# EasyEDA Pro project IMPORT-THIS-IN-KICAD.epro, board PCB1
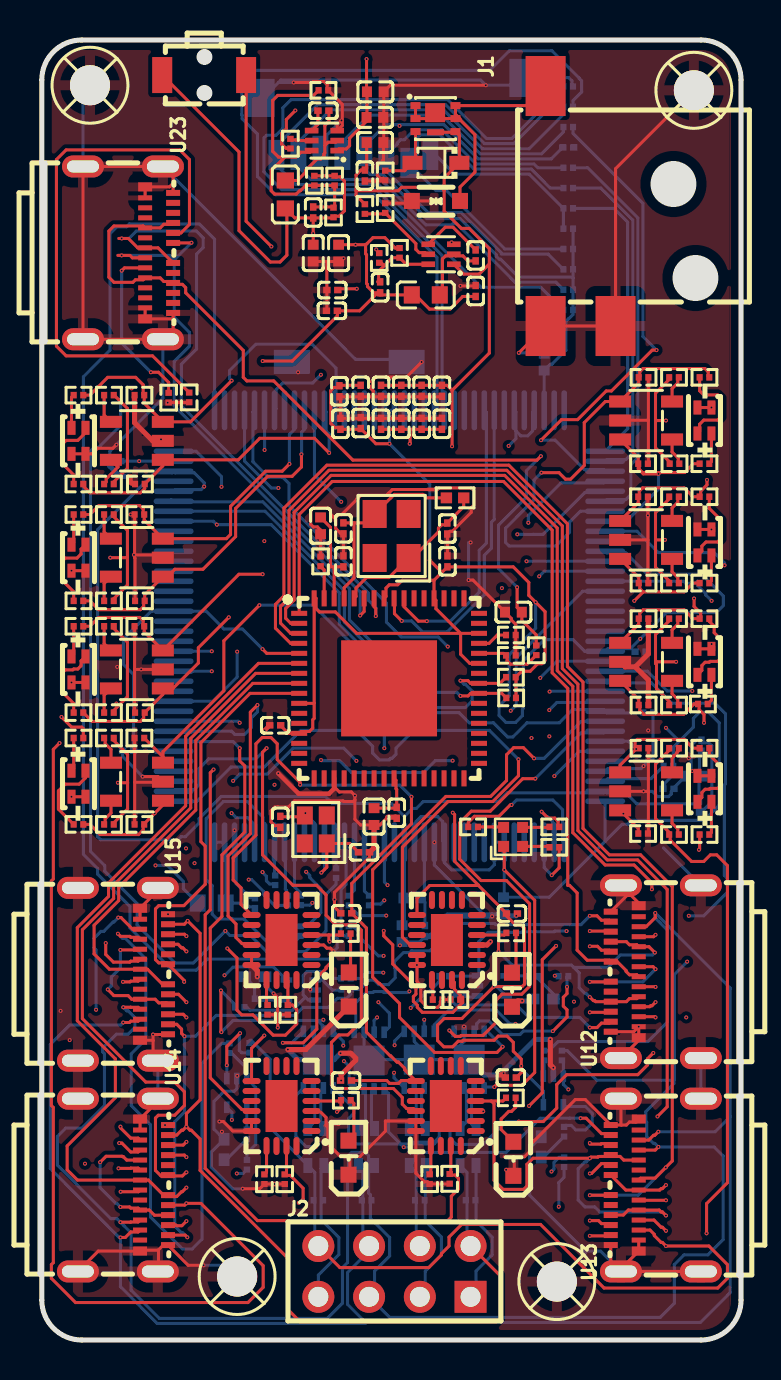
[diagram p1: board, top side]
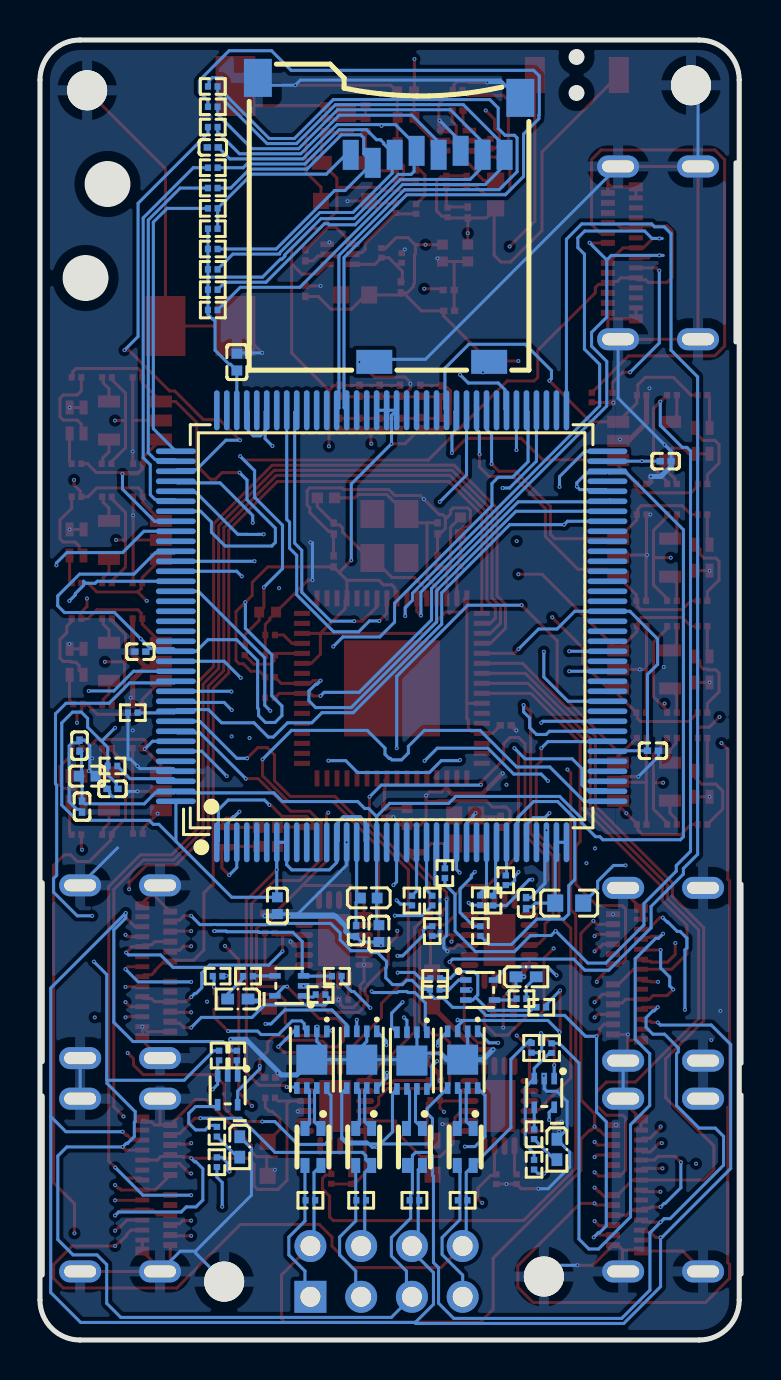
[diagram p2: board, bottom side, seen from below]

Outline 35.09 x 65 mm; copper layers: Top Layer, Inner1, Inner2, Bottom Layer. Coordinates in mm from the lower left corner of the outline.
Outline path: 0.09,63 0.09,2 arc(0.68,0.59) 2.09,0 33.09,0 arc(34.51,0.59) 35.09,2 35.09,63 arc(34.51,64.41) 33.09,65 2.09,65 arc(0.68,64.41) 0.09,63
Stack: Top Layer 0.035mm Outer layer thickness 1oz / dielectric 0.2104mm 7628 RC49% 8.6mil / dielectric 1.065mm 1.1mm H/HOZ Copper / dielectric 0.2104mm 7628 RC49% 8.6mil / Inner1 0.0152mm Inner layer thickness / Inner2 0.0152mm Inner layer thickness / Bottom Layer 0.035mm Outer layer thickness 1oz

## Placement (name value [footprint] x y rotation side)
C1  10uF  [C0402]  16.77 61.13 180 top
C2  10uF  [C0402]  16.79 62.41 180 top
C3  100nF  [C0201]  21.81 52.45 90 top
C4  100nF  [C0201]  17.03 52.64 270 top
C5  100nF  [C0201]  21.81 54.23 270 top
C6  100nF  [C0201]  16.26 58.22 270 top
C7  10uF  [C0402]  16.77 59.87 180 top
C8  10uF  [C0402]  13.68 54.34 90 top
C9  100nF  [C0201]  14.63 52.5 180 top
C10  100nF  [C0201]  13.68 56.38 270 top
C11  100nF  [C0201]  14.19 61.47 0 top
C12  100nF  [C0201]  14.61 51.46 180 top
C13  10uF  [C0402]  14.95 54.34 90 top
C14  100nF  [C0201]  20.12 45.81 270 top
C15  100nF  [C0201]  14.99 47.44 90 top
C16  100nF  [C0201]  17.07 47.46 90 top
C17  100nF  [C0201]  19.1 45.81 270 top
C18  100nF  [C0201]  16.05 45.85 270 top
C19  100nF  [C0201]  18.09 47.46 90 top
C20  100nF  [C0201]  18.09 45.81 270 top
C21  100nF  [C0201]  15.04 45.81 270 top
C22  100nF  [C0201]  19.1 47.46 90 top
C23  100nF  [C0201]  17.07 45.81 270 top
C24  100nF  [C0201]  16.05 47.46 90 top
C25  100nF  [C0201]  20.12 47.46 90 top
C26  10uF  [C0201]  23.62 21.32 180 top
C27  10uF  [C0201]  23.57 13.12 0 top
C28  10uF  [C0201]  15.32 12.97 0 top
C29  10uF  [C0201]  15.33 21.34 0 top
C30  10uF  [C0402]  25.24 48.89 270 bottom
C31  10uF  [C0402]  23.21 21.72 90 bottom
C32  100nF  [C0201]  31.46 27.56 180 bottom
C33  100nF  [C0201]  3.77 43.94 0 bottom
C34  100nF  [C0201]  4.41 29.46 0 bottom
C35  100nF  [C0201]  30.06 34.42 180 bottom
C36  100nF  [C0201]  10.76 21.84 270 bottom
C37  10uF  [C0402]  32.73 28.19 0 bottom
C38  220pF  [C0201]  19.27 20.45 270 bottom
C39  10uF  [C0402]  18.12 20.32 90 bottom
C40  100nF  [C0201]  32.98 26.67 90 bottom
C41  100nF  [C0201]  33.11 29.72 270 bottom
C42  12pF  [C0201]  16.22 24.38 0 top
C43  12pF  [C0201]  12.03 25.91 90 top
C44  10uF  [C0201]  26.44 59.63 180 bottom
C45  12pF  [C0201]  15.19 40.58 270 top
C46  100nF  [C0201]  20.4 38.93 270 top
C47  100nF  [C0201]  11.78 30.73 0 top
C48  10uF  [C0402]  23.7 36.39 0 top
C49  10uF  [C0402]  16.72 26.17 90 top
C50  100nF  [C0201]  17.86 26.36 90 top
C51  100nF  [C0201]  15.19 38.93 270 top
C52  10uF  [C0402]  14.05 40.71 90 top
C53  12pF  [C0201]  20.39 40.57 270 top
D1  B140WS-7  [SOD-323_L1.8-W1.3-LS2.5-RD]  19.82 58.86 180 top
D2  SOD-323  [SOD-323_L1.7-W1.3-LS2.5-BI]  19.82 56.95 180 top
J1  DC-044D-2.5A-2.0-SMT  [DC-IN-SMD_DC-044D-2.5A-2.0-SMT]  27.06 56.7 270 top
J2  SSQ-104-04-T-D  [HDR-TH_8P-P2.54_SSW-104-23-F-D]  17.74 3.43 0 top
L1  3.3uH  [L0603]  19.31 52.25 180 top
L2  3.3uH  [L0603]  12.28 57.28 270 top
L3  ACM2012-900-2P-T001  [FILTER-SMD_4P-L2.0-W1.2-TL_ACM2012E]  21.43 9.65 270 bottom
L4  ACM2012-900-2P-T001  [FILTER-SMD_4P-L2.0-W1.2-TL_ACM2012E]  18.89 9.65 270 bottom
L5  ACM2012-900-2P-T001  [FILTER-SMD_4P-L2.0-W1.2-TL_ACM2012E]  16.35 9.65 270 bottom
L6  ACM2012-900-2P-T001  [FILTER-SMD_4P-L2.0-W1.2-TL_ACM2012E]  13.81 9.65 270 bottom
L7  2.2uH  [L0402]  18.63 22.1 0 bottom
L8  3.3uH  [L0603]  8.6 21.84 0 bottom
LED1  APHHS1005LSECK/J3-PF  [LED0402-RD_RED]  25.19 17.05 0 bottom
LED2  APHHS1005LSECK/J3-PF  [LED0402-RD_RED]  10.76 18.16 180 bottom
LED3  APHHS1005LSECK/J3-PF  [LED0402-RD_RED]  25.09 9.65 270 bottom
LED4  APHHS1005LSECK/J3-PF  [LED0402-RD_RED]  9.22 9.53 270 bottom
LED5  HSMF-C163  [LED-SMD_L1.6-W0.8_HSMF-C163]  1.93 27.81 270 top
LED6  HSMF-C163  [LED-SMD_L1.6-W0.8_HSMF-C163]  1.93 33.53 270 top
LED7  HSMF-C163  [LED-SMD_L1.6-W0.8_HSMF-C163]  1.93 39.12 270 top
LED8  HSMF-C163  [LED-SMD_L1.6-W0.8_HSMF-C163]  1.93 44.96 270 top
LED9  HSMF-C163  [LED-SMD_L1.6-W0.8_HSMF-C163]  33.26 45.97 90 top
LED10  HSMF-C163  [LED-SMD_L1.6-W0.8_HSMF-C163]  33.26 39.88 90 top
LED11  HSMF-C163  [LED-SMD_L1.6-W0.8_HSMF-C163]  33.26 33.91 90 top
LED12  HSMF-C163  [LED-SMD_L1.6-W0.8_HSMF-C163]  33.26 27.56 90 top
LED13  SLED-0603-H0_8MM_C9900013124  [LED0603-R-RD_RED]  23.62 17.51 90 top
LED14  SLED-0603-H0_8MM_C9900013124  [LED0603-R-RD_RED]  23.7 9.06 90 top
LED15  SLED-0603-H0_8MM_C9900013124  [LED0603-R-RD_RED]  15.44 9.12 90 top
LED16  SLED-0603-H0_8MM_C9900013124  [LED0603-R-RD_RED]  15.46 17.53 90 top
LED17  TZ1615RGB3U-Common Yang  [LED-SMD_TZ1615RGB3U-COMMON-YANG]  23.68 25.16 0 top
Q1  AON2403  [DFN-6_L2.0-W2.0-P0.65-BL-EP-1]  19.8 61.05 270 top
Q2  QS5K2TR  [SOT-23-5_L2.9-W1.6-P0.95-LS2.8-TL]  4.86 27.92 180 top
Q3  QS5K2TR  [SOT-23-5_L2.9-W1.6-P0.95-LS2.8-TL]  4.85 33.53 180 top
Q4  QS5K2TR  [SOT-23-5_L2.9-W1.6-P0.95-LS2.8-TL]  4.85 39.12 180 top
Q5  QS5K2TR  [SOT-23-5_L2.9-W1.6-P0.95-LS2.8-TL]  4.85 44.96 180 top
Q6  QS5K2TR  [SOT-23-5_L2.9-W1.6-P0.95-LS2.8-TL]  30.34 45.97 0 top
Q7  QS5K2TR  [SOT-23-5_L2.9-W1.6-P0.95-LS2.8-TL]  30.34 40 0 top
Q8  QS5K2TR  [SOT-23-5_L2.9-W1.6-P0.95-LS2.8-TL]  30.34 33.91 0 top
Q9  QS5K2TR  [SOT-23-5_L2.9-W1.6-P0.95-LS2.8-TL]  30.34 27.43 0 top
R1  52.3kΩ  [R0201]  18 54.36 90 top
R2  10kΩ  [R0201]  16.98 54.1 90 top
R3  10kΩ  [R0201]  17.28 56.6 90 top
R4  10kΩ  [R0201]  16.26 56.55 270 top
R5  1kΩ  [R0201]  17.28 58.22 270 top
R6  100kΩ  [R0201]  14.75 57.97 90 top
R7  100kΩ  [R0201]  13.73 57.97 90 top
R8  100kΩ  [R0201]  14.69 56.38 270 top
R9  10kΩ  [R0201]  14.19 62.48 180 top
R10  10kΩ  [R0201]  12.54 59.82 270 top
R11  62Ω  [R0201]  21.55 6.99 180 bottom
R12  62Ω  [R0201]  19.01 6.99 180 bottom
R13  62Ω  [R0201]  16.35 6.99 180 bottom
R14  62Ω  [R0201]  13.93 6.99 180 bottom
R15  10kΩ  [R0201]  21.05 17.27 0 bottom
R16  10kΩ  [R0201]  20.23 18.19 0 bottom
R17  100kΩ  [R0201]  26.2 18.19 0 bottom
R18  2.7kΩ  [R0201]  24.68 18.19 0 bottom
R19  10kΩ  [R0201]  15.33 17.53 180 bottom
R20  10kΩ  [R0201]  15.31 18.08 180 bottom
R21  100kΩ  [R0201]  10 16.64 180 bottom
R22  2.7kΩ  [R0201]  10.99 17.07 180 bottom
R23  10kΩ  [R0201]  25.24 14.22 270 bottom
R24  10kΩ  [R0201]  26.13 14.22 270 bottom
R25  100kΩ  [R0201]  26.23 8.89 270 bottom
R26  2.7kΩ  [R0201]  26.23 10.41 270 bottom
R27  10kΩ  [R0201]  10.49 14.61 270 bottom
R28  10kΩ  [R0201]  9.48 14.59 270 bottom
R29  100kΩ  [R0201]  10.36 8.76 270 bottom
R30  2.7kΩ  [R0201]  10.36 10.29 270 bottom
R31  10kΩ  [R0201]  4.98 25.78 0 top
R32  10kΩ  [R0201]  4.98 30.1 0 top
R33  1kΩ  [R0201]  3.45 25.78 0 top
R34  100Ω  [R0201]  3.45 30.1 0 top
R35  100Ω  [R0201]  1.93 30.1 0 top
R36  100Ω  [R0201]  1.93 25.78 0 top
R37  10kΩ  [R0201]  5 31.37 0 top
R38  100Ω  [R0201]  1.93 35.69 0 top
R39  100Ω  [R0201]  1.93 31.37 0 top
R40  1kΩ  [R0201]  3.45 31.37 0 top
R41  100Ω  [R0201]  3.45 35.69 0 top
R42  10kΩ  [R0201]  4.98 35.69 0 top
R43  100Ω  [R0201]  1.93 41.28 0 top
R44  100Ω  [R0201]  1.93 36.96 0 top
R45  1kΩ  [R0201]  3.45 36.96 0 top
R46  100Ω  [R0201]  3.45 41.28 0 top
R47  10kΩ  [R0201]  5 36.96 0 top
R48  10kΩ  [R0201]  4.98 41.28 0 top
R49  100Ω  [R0201]  1.93 47.24 0 top
R50  100Ω  [R0201]  1.93 42.8 0 top
R51  1kΩ  [R0201]  3.45 42.8 0 top
R52  100Ω  [R0201]  3.45 47.24 0 top
R53  10kΩ  [R0201]  5 42.8 0 top
R54  10kΩ  [R0201]  4.98 47.24 0 top
R55  100Ω  [R0201]  33.26 43.81 180 top
R56  100Ω  [R0201]  33.26 48.13 0 top
R57  1kΩ  [R0201]  31.74 48.13 180 top
R58  100Ω  [R0201]  31.76 43.81 180 top
R59  10kΩ  [R0201]  30.21 48.13 180 top
R60  10kΩ  [R0201]  30.19 43.81 180 top
R61  100Ω  [R0201]  33.26 37.85 180 top
R62  100Ω  [R0201]  33.26 42.16 180 top
R63  1kΩ  [R0201]  31.74 42.16 180 top
R64  100Ω  [R0201]  31.74 37.85 180 top
R65  10kΩ  [R0201]  30.19 42.16 180 top
R66  10kΩ  [R0201]  30.21 37.85 180 top
R67  100Ω  [R0201]  33.18 31.8 180 top
R68  100Ω  [R0201]  33.26 36.07 180 top
R69  1kΩ  [R0201]  31.74 36.07 180 top
R70  100Ω  [R0201]  31.74 31.75 180 top
R71  10kΩ  [R0201]  30.21 36.07 180 top
R72  10kΩ  [R0201]  30.21 31.75 180 top
R73  100Ω  [R0201]  33.26 25.27 180 top
R74  100Ω  [R0201]  33.26 29.59 180 top
R75  1kΩ  [R0201]  31.74 29.59 180 top
R76  100Ω  [R0201]  31.74 25.27 180 top
R77  10kΩ  [R0201]  30.21 29.59 180 top
R78  10kΩ  [R0201]  30.19 25.32 180 top
R79  28kΩ  [R0201]  19.9 17.02 0 top
R80  33kΩ  [R0201]  20.79 17.02 180 top
R81  3.3kΩ  [R0201]  23.59 20.36 180 top
R82  33kΩ  [R0201]  20.51 8.06 270 top
R83  28kΩ  [R0201]  19.5 8.04 270 top
R84  3.3kΩ  [R0201]  23.57 12.11 180 top
R85  33kΩ  [R0201]  12.25 8.04 270 top
R86  28kΩ  [R0201]  11.24 8.04 270 top
R87  3.3kΩ  [R0201]  15.31 11.99 180 top
R88  33kΩ  [R0201]  12.41 16.51 270 top
R89  28kΩ  [R0201]  11.39 16.51 270 top
R90  3.3kΩ  [R0201]  15.31 20.32 180 top
R91  1kΩ  [R0201]  25.75 24.64 180 top
R92  1kΩ  [R0201]  25.75 25.65 0 top
R93  1kΩ  [R0201]  21.68 25.65 180 top
R94  100kΩ  [R0201]  13.06 21.98 270 bottom
R95  100kΩ  [R0201]  12.41 21.97 270 bottom
R96  100kΩ  [R0201]  11.78 22.99 270 bottom
R97  100kΩ  [R0201]  13.05 20.45 90 bottom
R98  100kΩ  [R0201]  16.47 21.97 270 bottom
R99  100kΩ  [R0201]  15.46 21.97 270 bottom
R100  100kΩ  [R0201]  15.46 20.45 90 bottom
R101  100kΩ  [R0201]  14.82 23.34 270 bottom
R102  10kΩ  [R0201]  31.46 28.7 0 bottom
R103  10kΩ  [R0201]  30.44 31.37 180 bottom
R104  10kΩ  [R0201]  26.44 52.52 0 bottom
R105  10kΩ  [R0201]  26.44 51.5 0 bottom
R106  10kΩ  [R0201]  26.44 55.57 0 bottom
R107  10kΩ  [R0201]  26.44 54.55 0 bottom
R108  10kΩ  [R0201]  26.44 53.53 0 bottom
R109  0Ω  [R0201]  26.44 61.66 0 bottom
R110  0Ω  [R0201]  26.44 62.68 0 bottom
R111  0Ω  [R0201]  26.44 56.58 0 bottom
R112  0Ω  [R0201]  26.44 57.6 0 bottom
R113  0Ω  [R0201]  26.44 58.61 0 bottom
R114  0Ω  [R0201]  26.44 60.65 0 bottom
R115  10kΩ  [R0201]  7.47 47.13 270 top
R116  10kΩ  [R0201]  6.44 47.12 90 top
R117  12kΩ  [R0201]  14.05 38.93 90 top
R118  1MΩ  [R0402]  20.78 42.11 180 top
R119  10kΩ  [R0201]  23.57 35.25 180 top
R120  10kΩ  [R0201]  23.57 33.14 180 top
R121  10kΩ  [R0201]  23.58 32.1 180 top
R122  100kΩ  [R0201]  24.84 34.49 270 top
R123  100kΩ  [R0201]  23.57 34.23 0 top
SCREW1  -  [Screw-Hole-M2]  32.73 62.48 0 top
SCREW2  -  [Screw-Hole-M2]  2.5 62.74 0 top
SCREW3  -  [Screw-Hole-M2]  25.87 2.92 0 top
SCREW4  -  [Screw-Hole-M2]  9.87 3.18 0 top
SW1  TS-1809-T20  [SW-SMD_L3.9-W2.9-LS4.8SWQC_SPST]  8.22 63.25 90 top
U1  AP62300Z6-7  [SOT-563-6_L1.6-W1.2-P0.50-LS1.6-BL]  20.07 54.29 90 top
U2  AP62300Z6-7  [SOT-563-6_L1.6-W1.2-P0.50-LS1.6-BL]  14.24 59.97 90 top
U3  MCP2542FDT-E/MNY  [TDFN-8_L3.0-W2.0-P0.50-TL-EP]  21.48 14.02 270 bottom
U4  MCP2542FDT-E/MNY  [TDFN-8_L3.0-W2.0-P0.50-TL-EP]  18.98 14.02 270 bottom
U5  MCP2542FDT-E/MNY  [TDFN-8_L3.0-W2.0-P0.50-TL-EP]  16.47 13.97 270 bottom
U6  MCP2542FDT-E/MNY  [TDFN-8_L3.0-W2.0-P0.50-TL-EP]  13.93 14.02 270 bottom
U7  NCS20071XV53T2G  [SOT-553-5_L1.6-W1.2-P0.50-LS1.6-BL]  22.61 17.71 90 bottom
U8  NCS20071XV53T2G  [SOT-553-5_L1.6-W1.2-P0.50-LS1.6-BL]  13.06 17.5 270 bottom
U9  NCS20071XV53T2G  [SOT-553-5_L1.6-W1.2-P0.50-LS1.6-BL]  25.7 12.48 0 bottom
U10  NCS20071XV53T2G  [SOT-553-5_L1.6-W1.2-P0.50-LS1.6-BL]  9.85 12.35 0 bottom
U11  TPS25944ARVCR  [WQFN-20_L4.0-W3.0-P0.50-BL-EP]  20.37 20 90 top
U12  USB4081-03-A  [USB-SMD_USB4081-03-A]  30.83 18.42 90 top
U13  USB4081-03-A  [USB-SMD_USB4081-03-A]  30.83 7.75 90 top
U14  USB4081-03-A  [USB-SMD_USB4081-03-A]  4.16 7.75 270 top
U15  USB4081-03-A  [USB-SMD_USB4081-03-A]  4.16 18.29 270 top
U16  TPS25944ARVCR  [WQFN-20_L4.0-W3.0-P0.50-BL-EP]  20.31 11.7 90 top
U17  TPS25944ARVCR  [WQFN-20_L4.0-W3.0-P0.50-BL-EP]  12.09 11.7 90 top
U18  TPS25944ARVCR  [WQFN-20_L4.0-W3.0-P0.50-BL-EP]  12.09 20 90 top
U19  USB2517-JZX-TR  [QFN-64_L9.0-W9.0-P0.50-BL-EP4.8]  17.47 32.58 270 top
U20  24MHz  [CRYSTAL-SMD_4P-L3.2-W2.5-BL]  17.6 40.2 90 top
U21  STM32H725ZGT6  [LQFP-144_L20.0-W20.0-P0.50-LS22.0-BL]  17.49 35.69 180 bottom
U22  XDTP-1001-098  [MICRO-SD-SMD_XDTP-1001-098]  17.62 56.01 0 bottom
U23  USB4081-03-A  [USB-SMD_USB4081-03-A]  4.41 54.36 270 top
X1  25MHz  [CRYSTAL-SMD_4P-L2.0-W1.6-BL]  13.81 25.53 90 top

## Footprints (pads in the part's own frame, mm; a bottom-side part is the same pattern mirrored in y, then rotated)
C0201
  rect 0.368x0.324 smd: 1(-0.275,0) 2(0.275,0)
C0402
  rect 0.5x0.54 smd: 1(-0.42,0) 2(0.42,0)
CRYSTAL-SMD_4P-L2.0-W1.6-BL
  rect 0.9x0.8 smd: 1(-0.7,-0.55) 2(0.7,-0.55) 3(0.7,0.55) 4(-0.7,0.55)
CRYSTAL-SMD_4P-L3.2-W2.5-BL
  rect 1.4x1.2 smd: 1(-1.1,-0.85) 2(1.1,-0.85) 3(1.1,0.85) 4(-1.1,0.85)
DC-IN-SMD_DC-044D-2.5A-2.0-SMT
  rect 3x2 smd: 3(-6,-1.75) 4(6,-1.75) 5(6,1.75)
DFN-6_L2.0-W2.0-P0.65-BL-EP-1
  rect 0.35x0.5 smd: 1(-0.667,-1) 2(-0.018,-1) 3(0.632,-1) 4(0.632,1) 5(-0.018,1) 6(-0.667,1)
  rect 0.95x1 smd: 7(-0.312,-0.018)
  rect 0.3x0.85 smd: 8(0.667,0)
FILTER-SMD_4P-L2.0-W1.2-TL_ACM2012E
  rect 0.75x0.448 smd: 1(-0.925,0.4) 2(-0.925,-0.4) 3(0.925,-0.4) 4(0.925,0.4)
HDR-TH_8P-P2.54_SSW-104-23-F-D
  rect 1.6x1.6 hole 1: 1(3.81,-1.27)
  round 1.6 hole 1: 2(3.81,1.27) 3(1.27,-1.27) 4(1.27,1.27) 5(-1.27,-1.27) 6(-1.27,1.27) 7(-3.81,-1.27) 8(-3.81,1.27)
L0402
  rect 0.54x0.54 smd: 1(-0.42,0) 2(0.42,0)
L0603
  rect 0.8x0.864 smd: 1(-0.7,0) 2(0.7,0)
LED0402-RD_RED
  rect 0.636x0.54 smd: 1(-0.508,0) 2(0.508,0)
LED0603-R-RD_RED
  rect 0.8x0.8 smd: 1(0.851,0) 2(-0.851,0)
LED-SMD_L1.6-W0.8_HSMF-C163
  rect 0.7x0.4 smd: 1(-0.65,0.35) 2(-0.65,-0.35) 3(0.65,0.35) 4(0.65,-0.35)
LED-SMD_TZ1615RGB3U-COMMON-YANG
  rect 0.55x0.55 smd: 1(-0.475,-0.475) 2(0.475,-0.475) 3(0.475,0.475) 4(-0.475,0.475)
LQFP-144_L20.0-W20.0-P0.50-LS22.0-BL
  oval 0.28x2 smd: 1(-8.75,-10.8) 2(-8.25,-10.8) 3(-7.75,-10.8) 4(-7.25,-10.8) 5(-6.75,-10.8) 6(-6.25,-10.8) 7(-5.75,-10.8) 8(-5.25,-10.8) 9(-4.75,-10.8) 10(-4.25,-10.8) 11(-3.75,-10.8) 12(-3.25,-10.8) 13(-2.75,-10.8) 14(-2.25,-10.8) 15(-1.75,-10.8) 16(-1.25,-10.8) 17(-0.75,-10.8) 18(-0.25,-10.8) 19(0.25,-10.8) 20(0.75,-10.8) 21(1.25,-10.8) 22(1.75,-10.8) 23(2.25,-10.8) 24(2.75,-10.8) 25(3.25,-10.8) 26(3.75,-10.8) 27(4.25,-10.8) 28(4.75,-10.8) 29(5.25,-10.8) 30(5.75,-10.8) 31(6.25,-10.8) 32(6.75,-10.8) 33(7.25,-10.8) 34(7.75,-10.8) 35(8.25,-10.8) 36(8.75,-10.8) 73(8.75,10.8) 74(8.25,10.8) 75(7.75,10.8) 76(7.25,10.8) 77(6.75,10.8) 78(6.25,10.8) 79(5.75,10.8) 80(5.25,10.8) 81(4.75,10.8) 82(4.25,10.8) 83(3.75,10.8) 84(3.25,10.8) 85(2.75,10.8) 86(2.25,10.8) 87(1.75,10.8) 88(1.25,10.8) 89(0.75,10.8) 90(0.25,10.8) 91(-0.25,10.8) 92(-0.75,10.8) 93(-1.25,10.8) 94(-1.75,10.8) 95(-2.25,10.8) 96(-2.75,10.8) 97(-3.25,10.8) 98(-3.75,10.8) 99(-4.25,10.8) 100(-4.75,10.8) 101(-5.25,10.8) 102(-5.75,10.8) 103(-6.25,10.8) 104(-6.75,10.8) 105(-7.25,10.8) 106(-7.75,10.8) 107(-8.25,10.8) 108(-8.75,10.8)
  oval 2x0.28 smd: 37(10.8,-8.75) 38(10.8,-8.25) 39(10.8,-7.75) 40(10.8,-7.25) 41(10.8,-6.75) 42(10.8,-6.25) 43(10.8,-5.75) 44(10.8,-5.25) 45(10.8,-4.75) 46(10.8,-4.25) 47(10.8,-3.75) 48(10.8,-3.25) 49(10.8,-2.75) 50(10.8,-2.25) 51(10.8,-1.75) 52(10.8,-1.25) 53(10.8,-0.75) 54(10.8,-0.25) 55(10.8,0.25) 56(10.8,0.75) 57(10.8,1.25) 58(10.8,1.75) 59(10.8,2.25) 60(10.8,2.75) 61(10.8,3.25) 62(10.8,3.75) 63(10.8,4.25) 64(10.8,4.75) 65(10.8,5.25) 66(10.8,5.75) 67(10.8,6.25) 68(10.8,6.75) 69(10.8,7.25) 70(10.8,7.75) 71(10.8,8.25) 72(10.8,8.75) 109(-10.8,8.75) 110(-10.8,8.25) 111(-10.8,7.75) 112(-10.8,7.25) 113(-10.8,6.75) 114(-10.8,6.25) 115(-10.8,5.75) 116(-10.8,5.25) 117(-10.8,4.75) 118(-10.8,4.25) 119(-10.8,3.75) 120(-10.8,3.25) 121(-10.8,2.75) 122(-10.8,2.25) 123(-10.8,1.75) 124(-10.8,1.25) 125(-10.8,0.75) 126(-10.8,0.25) 127(-10.8,-0.25) 128(-10.8,-0.75) 129(-10.8,-1.25) 130(-10.8,-1.75) 131(-10.8,-2.25) 132(-10.8,-2.75) 133(-10.8,-3.25) 134(-10.8,-3.75) 135(-10.8,-4.25) 136(-10.8,-4.75) 137(-10.8,-5.25) 138(-10.8,-5.75) 139(-10.8,-6.25) 140(-10.8,-6.75) 141(-10.8,-7.25) 142(-10.8,-7.75) 143(-10.8,-8.25) 144(-10.8,-8.75)
MICRO-SD-SMD_XDTP-1001-098
  rect 0.8x1.501 smd: 1(1.919,-3.251) 2(0.82,-2.851) 3(-0.281,-3.252) 4(-1.38,-3.45) 5(-2.48,-3.252) 6(-3.58,-3.453) 7(-4.681,-3.252)
  rect 0.8x1.5 smd: 8(-5.78,-3.251)
  rect 1.399x1.9 smd: 10(-6.569,-6.1) 10(6.569,-7.1)
  rect 1.8x1.2 smd: 10(-5.01,7.1) 10(0.74,7.1)
QFN-64_L9.0-W9.0-P0.50-BL-EP4.8
  rect 0.25x0.8 smd: 1(-3.75,-4.5) 2(-3.25,-4.5) 3(-2.75,-4.5) 4(-2.25,-4.5) 5(-1.75,-4.5) 6(-1.25,-4.5) 7(-0.75,-4.5) 8(-0.25,-4.5) 9(0.25,-4.5) 10(0.75,-4.5) 11(1.25,-4.5) 12(1.75,-4.5) 13(2.25,-4.5) 14(2.75,-4.5) 15(3.25,-4.5) 16(3.75,-4.5) 33(3.75,4.5) 34(3.25,4.5) 35(2.75,4.5) 36(2.25,4.5) 37(1.75,4.5) 38(1.25,4.5) 39(0.75,4.5) 40(0.25,4.5) 41(-0.25,4.5) 42(-0.75,4.5) 43(-1.25,4.5) 44(-1.75,4.5) 45(-2.25,4.5) 46(-2.75,4.5) 47(-3.25,4.5) 48(-3.75,4.5)
  rect 0.8x0.25 smd: 17(4.5,-3.75) 18(4.5,-3.25) 19(4.5,-2.75) 20(4.5,-2.25) 21(4.5,-1.75) 22(4.5,-1.25) 23(4.5,-0.75) 24(4.5,-0.25) 25(4.5,0.25) 26(4.5,0.75) 27(4.5,1.25) 28(4.5,1.75) 29(4.5,2.25) 30(4.5,2.75) 31(4.5,3.25) 32(4.5,3.75) 49(-4.5,3.75) 50(-4.5,3.25) 51(-4.5,2.75) 52(-4.5,2.25) 53(-4.5,1.75) 54(-4.5,1.25) 55(-4.5,0.75) 56(-4.5,0.25) 57(-4.5,-0.25) 58(-4.5,-0.75) 59(-4.5,-1.25) 60(-4.5,-1.75) 61(-4.5,-2.25) 62(-4.5,-2.75) 63(-4.5,-3.25) 64(-4.5,-3.75)
  rect 4.8x4.8 smd: 65(0,0)
R0201
  rect 0.303x0.324 smd: 1(-0.241,0) 2(0.241,0)
R0402
  rect 0.566x0.54 smd: 1(-0.433,0) 2(0.433,0)
Screw-Hole-M2
  round 2 hole 2: 1(0,0)
SOD-323_L1.7-W1.3-LS2.5-BI
  rect 0.8x0.8 smd: 1(-1.205,0) 2(1.205,0)
SOD-323_L1.8-W1.3-LS2.5-RD
  rect 1x0.7 smd: 1(-1.173,0) 2(1.173,0)
SOT-23-5_L2.9-W1.6-P0.95-LS2.8-TL
  rect 1.1x0.6 smd: 1(-1.3,0.95) 2(-1.3,0) 3(-1.3,-0.95) 4(1.3,-0.95) 5(1.3,0.95)
SOT-553-5_L1.6-W1.2-P0.50-LS1.6-BL
  rect 0.28x0.58 smd: 1(-0.5,-0.718) 2(0,-0.718) 3(0.5,-0.718) 4(0.5,0.718) 5(-0.5,0.718)
SOT-563-6_L1.6-W1.2-P0.50-LS1.6-BL
  rect 0.28x0.68 smd: 1(-0.5,-0.64) 2(0,-0.64) 3(0.5,-0.64) 4(0.5,0.64) 5(0,0.64) 6(-0.5,0.64)
SW-SMD_L3.9-W2.9-LS4.8SWQC_SPST
  rect 1.8x1 smd: 1(0,2.1) 2(0,-2.1)
TDFN-8_L3.0-W2.0-P0.50-TL-EP
  rect 0.585x0.28 smd: 1(-1.417,0.75) 2(-1.417,0.25) 3(-1.417,-0.25) 4(-1.417,-0.75) 5(1.417,-0.75) 6(1.417,-0.25) 7(1.417,0.25) 8(1.417,0.75)
  rect 1.5x1.55 smd: 9(0,0)
USB-SMD_USB4081-03-A
  oval 1.1x2.1 hole 0.6x1.6: 1(-4.32,1.745) 2(4.32,1.745) 3(4.32,-2.255) 4(-4.32,-2.255)
  rect 0.45x0.7 smd: 5(-3.3,0.855) 6(3.3,0.855)
  rect 0.3x0.7 smd: A1(-3,2.255) A2(-2.5,2.255) A3(-2,2.255) A4(-1.498,2.255) A5(-0.998,2.255) A6(-0.498,2.255) A7(0.502,2.255) A8(1.002,2.255) A9(1.502,2.255) A10(2.002,2.255) A11(2.502,2.255) A12(3.002,2.255)
  rect 0.25x0.7 smd: B1(2.75,0.855) B2(2.25,0.855) B3(1.75,0.855) B4(1.25,0.855) B5(0.75,0.855) B6(0.25,0.855) B7(-0.25,0.855) B8(-0.75,0.855) B9(-1.25,0.855) B10(-1.75,0.855) B11(-2.25,0.855) B12(-2.75,0.855)
WQFN-20_L4.0-W3.0-P0.50-BL-EP
  oval 0.3x0.9 smd: 1(-1.25,-1.5) 2(-0.75,-1.5) 3(-0.25,-1.5) 4(0.25,-1.5) 5(0.75,-1.5) 6(1.25,-1.5) 11(1.25,1.5) 12(0.75,1.5) 13(0.25,1.5) 14(-0.25,1.5) 15(-0.75,1.5) 16(-1.25,1.5)
  oval 0.9x0.3 smd: 7(2,-0.75) 8(2,-0.25) 9(2,0.25) 10(2,0.75) 17(-2,0.75) 18(-2,0.25) 19(-2,-0.25) 20(-2,-0.75)
  rect 2.6x1.6 smd: 21(0,0)

## Nets
As in the schematic, except:
GND: C1.1 C2.1 C3.2 C6.2 C7.1 C8.1 C9.2 C12.2 C13.1 C14.1 C15.1 C16.1 C17.1 C18.1 C19.1 C20.1 C21.1 C22.1 C23.1 C24.1 C25.1 C26.1 C27.1 C28.1 C29.1 C30.1 C31.1 C32.1 C33.1 C34.1 C35.1 C36.1 C37.1 C38.2 C39.1 C40.1 C41.1 C42.2 C43.1 C45.2 C46.1 C47.1 C48.1 C49.1 C50.1 C51.1 C52.1 C53.2 D2.2 J1.4 J1.5 LED1.1 LED2.1 LED3.1 LED4.1 LED5.3 LED5.4 LED6.3 LED6.4 LED7.3 LED7.4 LED8.3 LED8.4 LED9.3 LED9.4 LED10.3 LED10.4 LED11.3 LED11.4 LED12.3 LED12.4 LED13.2 LED14.2 LED15.2 LED16.2 Q2.2 Q3.2 Q4.2 Q5.2 Q6.2 Q7.2 Q8.2 Q9.2 R2.2 R3.2 R5.2 R9.1 R31.1 R32.1 R37.1 R42.1 R47.1 R48.1 R53.1 R54.1 R59.1 R60.1 R65.1 R66.1 R71.1 R72.1 R77.1 R78.1 R79.2 R80.2 R82.2 R83.2 R85.2 R86.2 R88.2 R89.2 R103.1 R115.2 R116.1 R117.2 R119.1 R123.2 SCREW1.1 SCREW2.1 SCREW3.1 SCREW4.1 U1.3 U2.3 U3.2 U3.9 U4.2 U4.9 U5.2 U5.9 U6.2 U6.9 U7.2 U8.2 U9.2 U10.2 U11.3 U11.15 U11.16 U12.1 U12.2 U12.3 U12.4 U12.5 U12.6 U12.A1 U12.A12 U12.B12 U13.1 U13.2 U13.3 U13.4 U13.5 U13.6 U13.A1 U13.A12 U13.B12 U14.1 U14.2 U14.3 U14.4 U14.5 U14.6 U14.A1 U14.A12 U14.B12 U15.1 U15.2 U15.3 U15.4 U15.5 U15.6 U15.A1 U15.A12 U15.B12 U16.3 U16.15 U16.16 U17.3 U17.15 U17.16 U18.3 U18.15 U18.16 U19.19 U21.14 U21.34 U21.141 U22.6 U22.10 U23.1 U23.2 U23.3 U23.4 U23.5 U23.6 U23.A1 U23.A12 U23.B1 U23.B12

Pads without a net: U11 1 2 5 6 7 8 9 10 12 13 18 20 21; U12 A5 B1 B5; U13 A5 B1 B5; U14 A5 B1 B5; U15 A5 B1 B5; U16 1 2 5 6 7 8 9 10 12 13 18 20 21; U17 1 2 5 6 7 8 9 10 12 13 18 20 21; U18 1 2 5 6 7 8 9 10 12 13 18 20 21; U19 11 12 14 15 16 17 18 20 21 22 23 24 26 27 28 29 30 31 32 33 34 35 36 37 38 39 42 47 48 49 50 51 53 54 65; U20 2 4; U21 4 5 6 9 10 11 12 18 20 27 33 39 40 41 46 48 49 51 53 54 55 57 58 59 60 61 62 63 64 69 74 75 80 86 87 88 89 93 94 97 98 99 102 104 107 108 118 124 125 126 127 128 140; U23 A2 A3 A8 A10 A11 B2 B3 B8 B10 B11; X1 2 4

## Via types
v1: diameter 0.2, hole 0.1, Top Layer to Bottom Layer, 318 vias

## Routing (per net, layer and track width the routed paths; a pad name or vN(x,y) marks a point on that pad's centre or on a via; arc(x,y) is an arc through that point)
+3V3: length 349.7
  Top Layer w0.152: 13.72,31.85 13.71,31.83 U19.10 ; 13.72,31.85 13.72,31.08 13.65,31.01 13.65,30.59 13.49,30.43 13.07,30.43 ; 13.72,31.85 U19.64 13.82,37.08 13.82,36.57 13.98,36.4 14.78,36.4 15.86,35.33 21.06,35.33 ; C10.2 v1(13.68,55.34) C8.2 ; C10.2 12.76,56.1 12.36,56.5 ; C10.2 14.66,56.1 R8.2 14.75,56.19 14.97,56.19 15.24,56.46 15.24,57.95 15.03,58.16 14.8,58.16 R6.2 R7.2 ; v1(11.14,34.54) 11.35,34.33 U19.5 ; U19.13 12.43,30.33 12.04,30.72 C47.2 ; 19.72,37.99 18.13,37.99 17.9,37.76 17.48,37.76 17.32,37.6 17.32,37.18 U19.57 ; 19.72,37.99 20.1,38.36 ; 19.72,37.99 U19.52 19.82,36.98 19.82,36.57 21.06,35.33 ; U19.43 21.51,33.83 21.06,34.29 21.06,35.33 ; 21.06,35.33 U19.46 ; C9.1 14.97,52.56 v1(15.86,52.56) ; R121.1 23.83,33.13 R120.1 24.11,33.44 24.53,33.44 24.91,33.81 25.12,33.81 25.28,33.98 25.28,36.42 v1(24.81,36.89) 24.47,37.23 24.47,37.88 23.69,38.66 C46.2 20.1,38.36 ; v1(22.74,12.65) 22.83,12.73 24.12,12.73 24.76,13.37 24.76,21.98 v1(23.24,23.51) 23.24,24.65 LED17.1 ; 20.1,38.36 20.1,38.4 v1(19.51,38.99) ; 12.36,56.5 L2.2 ; 12.36,56.5 12.36,54.24 12.02,53.9 11.53,53.9 9.96,55.47 9.96,59.4 SW1.1 ; C24.2 15.01,47.73 14.9,47.63 14.71,47.63 14.55,47.46 14.55,46.86 14.56,46.85 14.56,45.82 14.76,45.62 14.95,45.62 C21.2 16.01,45.53 16.05,45.58 16.82,44.81 v1(17.49,44.81)
  Inner1 w0.152: v1(17.49,44.81) 17.49,48.32 ; 17.49,48.32 17.49,50.93 v1(15.86,52.56) 13.68,54.74 v1(13.68,55.34) 13.68,56.39 v1(18,60.71) ; 17.49,48.32 17.44,48.26 v1(14.06,48.26) ; v1(30.05,35.06) 30.05,32.62 30.02,32.6 30.02,31.79 30.39,31.43 30.51,31.43 v1(31.33,30.61) ; v1(18.21,9.64) 19.73,9.64 v1(22.74,12.65)
  Inner2 w0.152: 1.44,33.27 1.25,33.07 1.25,32.74 1.3,32.69 1.3,31.39 1.41,31.29 1.41,31.02 1.3,30.91 1.3,30.62 0.86,30.62 0.54,30.93 0.54,34.42 5.04,38.92 5.04,43.86 v1(4.96,43.94) ; 1.44,33.27 2.55,34.38 5.06,34.38 6.28,35.6 10.08,35.6 v1(11.14,34.54) 8.95,32.35 3.61,32.35 3.29,32.04 3.29,31.6 3.61,31.29 4,31.29 5.37,29.92 8.91,29.92 10.2,28.63 10.2,26.95 v1(9.59,26.34) 9.33,26.09 8.14,26.09 7.48,25.42 6.61,25.42 6.06,24.87 6.06,24.01 v1(5.78,23.73) ; 1.44,33.27 1.44,33.21 ; v1(23.24,23.51) 18.16,23.51 v1(17.4,22.74) ; 5.17,43.94 9.13,43.94 10.53,45.34 11.14,45.34 v1(14.06,48.26)
  Bottom Layer w0.152: U21.119 28.37,39.36 29.32,39.36 30.39,38.29 33.11,38.29 34.2,37.2 34.2,36.72 33.86,36.37 31.36,36.37 v1(30.05,35.06) 29.56,34.57 28.42,34.57 U21.129 27.26,34.44 26.68,35.02 25.25,35.02 24.2,33.97 24.2,31.59 24.15,31.54 24.15,31.22 23.81,30.88 23.32,30.88 22.98,31.22 22.98,31.7 23.49,32.21 23.49,34.26 24.81,35.59 v1(24.81,36.89) ; 19.99,10.15 19.99,12.34 U4.5 ; 19.99,10.15 19.73,9.89 18.72,9.89 18.63,9.8 ; 19.99,10.15 19.99,10.06 19.73,9.8 18.63,9.8 ; v1(17.4,22.74) 17.24,22.9 U21.19 ; v1(11.14,34.54) 10.13,35.55 9.21,35.55 8.32,36.44 U21.56 5.56,36.44 4.18,35.05 4.18,33.78 4.68,33.27 C34.2 6.66,29.46 U21.42 ; U21.92 U21.91 U21.90 17.49,46.23 v1(17.49,44.81) 19.51,42.8 v1(19.51,38.99) ; 26.68,53.1 R108.2 R107.2 R106.2 ; 26.68,53.1 R104.2 R105.2 26.68,51.28 26.47,51.06 26.45,51.06 26.33,50.94 26.33,49.49 25.62,48.79 25.55,48.79 C30.2 25.24,46.49 U21.106 ; 26.68,53.1 26.63,53.14 23.95,53.14 23.06,54.04 22.98,54.04 22.83,54.19 22.83,54.26 21.03,56.07 19.37,56.07 17.16,58.28 16.52,58.28 16.36,58.43 16.36,59.83 17.3,60.77 20.22,60.77 21.93,59.06 25.59,59.06 C44.2 ; 32.04,29.97 31.97,29.97 v1(31.33,30.61) ; 32.04,29.97 32.71,30.64 32.71,31.08 33.02,31.39 33.46,31.39 34,30.85 34,26.74 33.24,25.98 29.62,25.98 29.42,25.78 29.14,25.78 28.28,24.93 ; 32.04,29.97 31.7,29.64 R102.2 31.7,28.27 31.27,27.84 31.27,27.64 C32.2 ; 28.28,24.93 28.28,26.93 ; 28.28,24.93 25.49,22.14 C31.2 23.24,22.17 v1(23.24,23.51) U21.7 U21.8 22.74,23.76 22.49,23.51 20.61,23.51 20.24,23.87 U21.13 20.16,24.97 20.16,25.92 19.91,26.17 19.07,26.17 18.82,25.92 18.82,24.97 U21.16 ; L8.1 7.18,22.57 7.18,22.93 6.38,23.73 v1(5.78,23.73) ; 18.63,9.8 18.04,9.8 ; 18.63,9.8 18.46,9.64 v1(18.21,9.64) 18.04,9.8 ; 18.04,9.8 15.7,9.8 15.45,10.06 15.45,11.07 15.71,11.33 15.71,11.57 U6.5 ; 18.04,9.8 17.45,10.4 17.45,12.33 U5.5 ; v1(22.74,12.65) 22.28,12.65 U3.5 ; v1(14.06,48.26) 13.65,47.85 12.15,47.85 11.82,47.52 11.82,46.57 U21.79 ; v1(9.59,26.34) 9.82,26.11 10.39,26.11 10.74,25.77 U21.32 ; U21.71 6.69,43.94 v1(4.96,43.94) C33.2
+5V: length 151.5
  Top Layer w0.152: 16.3,54.75 16.3,54.31 16.35,54.26 16.35,52.83 16.39,52.78 16.39,52.68 16.71,52.36 16.9,52.36 ; 16.3,54.75 16.67,55.12 17.26,55.12 17.78,54.6 R1.2 ; 16.3,54.75 16.28,54.77 v1(15.79,54.77) C13.2 ; v1(12.78,61.48) 12.33,61.03 12.33,60.56 12.1,60.33 12.1,59.79 12.26,59.63 12.28,59.63 12.33,59.58 R10.2 ; C3.1 21.16,52.18 20.53,51.54 19.5,51.54 18.86,52.18 18.69,52.18 18.61,52.25 17.01,52.25 16.9,52.36 ; v1(9.06,17.47) 9.06,15.42 9.08,15.39 ; C14.2 C17.2 18.53,45.53 ; v1(16.35,64.05) 16.35,62.43 C2.2 16.37,61.15 C1.2 16.35,60.94 15.5,60.09 15.5,59.72 15.33,59.55 14.96,59.55 14.94,59.53 14.94,59.53 14.88,59.47 ; 16.9,52.36 16,51.46 C12.1 14.89,51.21 12.63,48.95 v1(11.15,48.95) ; 18.53,45.53 C20.2 C23.2 ; 18.53,45.53 18.53,44.83 v1(18.51,44.81) ; v1(26.38,17.65) 26.38,17.32 26.2,17.14 26.2,16.7 26.38,16.51 26.38,16.15 v1(25.68,15.44)
  Inner1 w0.152: v1(25.68,15.44) 25.37,15.75 24.5,15.75 24.02,15.27 23.58,15.27 22.84,16.01 v1(19.23,16.01) 18.27,16.01 18.15,16.13 v1(16.87,16.13) 14.39,16.13 14.21,15.95 ; v1(11.15,48.95) 11.7,48.4 11.7,46.91 7.56,42.77 7.56,24.84 v1(7.31,24.58) ; v1(18.51,44.81) 17.75,45.57 17.75,51.43 15.79,53.38 v1(15.79,54.77) 18.58,57.55 18.58,60.95 16.35,63.18 v1(16.35,64.05) 13.78,61.48 v1(12.78,61.48)
  Inner2 w0.152: v1(9.06,17.47) 7.98,18.56 7.98,22.71 7.15,23.53 7.15,24.08 7.31,24.24 v1(7.31,24.58) ; 10.36,8.83 v1(9.85,8.33) ; 10.36,8.83 10.36,9.18 13.53,12.35 13.53,15.27 14.21,15.95 ; 10.36,8.83 22.5,8.83 24.67,6.66 v1(25.97,6.66)
  Bottom Layer w0.152: R21.2 9.76,16.78 v1(9.06,17.47) ; U6.3 14.18,15.69 13.9,15.98 ; 13.9,15.98 14.19,15.98 14.21,15.95 ; 13.9,15.98 9.66,15.98 v1(9.08,15.39) ; v1(9.85,8.33) 10.16,8.33 R29.2 ; v1(16.87,16.13) 16.72,15.98 U5.3 ; v1(25.97,6.66) 25.97,7.88 26.23,8.14 R25.2 ; U3.3 21.87,15.57 21.87,15.82 22,15.95 22.47,15.95 23.15,15.27 24.02,15.27 24.2,15.44 v1(25.68,15.44) ; R17.2 26.38,18.13 v1(26.38,17.65) ; U4.3 v1(19.23,16.01)
  vias: v1(14.18,16.01)
+12V: length 157.6
  Top Layer w0.152: 15.82,57.46 17.93,57.46 18.1,57.63 20.09,57.63 20.23,57.49 ; 15.82,57.46 15.82,58.25 16.07,58.5 C6.1 16.35,58.59 16.35,59.87 ; 15.82,57.46 15.82,57.23 R4.1 ; C28.2 17.36,12.97 17.5,12.83 17.94,12.83 18.09,12.97 18.79,12.97 ; 20.23,57.49 20.23,58.1 D1.1 20.99,60.22 Q1.4 20.76,60.39 Q1.8 ; 20.23,57.49 20.23,56.44 21.09,55.58 21.48,55.58 22.49,54.56 22.49,53.8 ; 21.95,22.72 21.95,22.74 20.75,23.93 20.75,26.27 v1(20.66,26.36) ; 21.95,22.72 C26.2 23.35,21.2 23.81,20.75 24.07,20.75 24.25,20.57 24.25,17.79 24.13,17.67 v1(22.72,17.67) 21.12,16.07 20.23,16.07 19.9,15.75 19.9,14.97 20.21,14.66 20.66,14.66 20.94,14.94 21.14,14.94 21.19,14.99 22.73,14.99 22.94,15.19 23.38,15.19 23.69,14.88 23.69,14.44 24.09,14.04 v1(24.09,13.7) 24.09,13.37 C27.2 ; 21.95,22.72 19.51,22.72 18.87,22.08 U11.11 ; U17.11 10.59,14.58 v1(11.23,15.22) ; 22.49,53.8 22.49,49.35 20.63,47.48 ; 22.49,53.8 21.98,53.3 21.21,53.3 U1.1 ; C16.2 C19.2 C22.2 C25.2 20.37,47.73 20.63,47.48 ; 18.79,12.97 U16.11 ; 18.79,12.97 18.26,13.51 18.26,13.58 17.94,13.9 17.87,13.9 17.56,14.21 17.53,14.21 16.34,15.39 16.34,20.6 C29.2 15.61,22.83 18.59,25.81 v1(18.59,27.16) ; 20.63,47.48 v1(20.63,44.69) ; U18.11 10.07,21.78 10.07,22.61 9.67,23 9.67,24.1 10.81,25.24 10.81,29.81 11.12,30.12 11.56,30.12 11.88,29.81 11.88,29.02 13.02,27.87 v1(13.02,27.76)
  Inner1 w0.152: v1(18.59,27.16) 19.87,27.16 v1(20.66,26.36) ; v1(9.24,18.24) 11.23,16.24 v1(11.23,15.22) 11.23,12.63 v1(9.61,11)
  Inner2 w0.152: v1(20.63,44.69) 20.63,42.65 23.67,39.61 24.69,39.61 25.71,38.59 25.71,35.8 18.34,28.43 18.34,27.41 v1(18.59,27.16) ; v1(11.23,15.22) 10.24,16.21 10.24,19.49 12.66,21.92 12.66,27.33 13.07,27.74
  Bottom Layer w0.152: 9.24,18.21 9.66,18.64 9.82,18.64 9.84,18.66 11.68,18.66 U8.5 ; v1(9.61,11) 9.61,11.38 U10.5 ; 13.07,27.74 18.01,27.74 v1(18.59,27.16) ; v1(22.72,17.67) 22.86,17.67 U7.5 ; U9.5 25.2,12.45 24.09,13.55 v1(24.09,13.7)
GND: length 516.6
  Top Layer w0.152: 29.1,10.75 28.57,10.75 27.3,12.02 26.79,12.02 24.51,9.73 24.51,9.42 24.25,9.16 23.74,9.16 ; 29.1,10.75 29.35,10.75 29.5,10.9 29.82,10.9 U13.6 ; 29.1,10.75 29.08,10.77 U13.2 ; U13.A1 28.57,3.94 U13.1 ; Q7.2 30.43,40 ; 30.43,40 30.43,37.87 R66.1 ; 30.43,40 v1(30.43,41.23) R65.1 ; LED15.2 15.51,8.33 15.51,9.17 ; 30.45,27.39 30.45,25.35 R78.1 ; 30.45,27.39 R77.1 ; 30.45,27.39 30.41,27.43 v1(30.21,27.43) Q9.2 ; 14.07,11.38 14.32,11.13 14.32,10.72 ; 16.68,47.16 C15.1 15.04,47.11 C21.1 C23.1 C20.1 C17.1 20.07,46.08 20.16,46 ; 16.68,47.16 16.68,47.45 16.55,47.58 v1(16.55,47.81) 16.55,47.89 16.81,48.15 18.35,48.15 v1(19.1,48.9) ; 16.68,47.16 20.1,47.16 C25.1 ; 15.76,27.01 v1(15.76,27.22) 15.59,27.4 14.98,27.4 14.72,27.66 ; 15.76,27.01 15.68,26.92 15.2,26.92 15.17,26.96 12.74,26.96 12.43,26.65 11.88,26.65 ; 15.76,27.01 15.76,26.03 16.05,25.75 C49.1 17.02,25.75 v1(17.4,26.14) ; 5.01,21.04 5.01,21.59 5.9,22.48 U15.1 ; U23.B1 U23.6 6.66,51.06 6.66,51.05 ; v1(15.09,60.98) 14.88,60.77 14.88,60.47 15.13,60.72 15.13,61.78 R9.1 14.38,62.54 14.38,62.76 14.21,62.92 13.68,62.92 13.63,62.88 v1(12.7,62.88) ; C46.1 20.4,40.29 C53.2 20.53,40.44 20.64,40.44 21.59,41.38 21.59,41.61 21.72,41.74 21.72,42.47 21.59,42.6 19.97,42.6 19.89,42.52 17.64,42.52 17.46,42.35 17.46,42.35 17.34,42.23 16.06,42.23 v1(15.87,42.04) 15.1,41.27 14.93,41.27 14.81,41.15 14.7,41.15 ; 5.93,4.49 5.93,4.51 6.17,4.75 U14.A12 7.42,3.74 v1(8.19,3.74) ; 5.93,4.49 5.93,3.46 U14.2 ; 5.93,4.49 5.05,4.49 5.01,4.45 2.92,4.45 U14.3 ; R116.1 7.46,46.88 R115.2 ; R32.1 4.74,29.44 4.74,29.43 4.74,27.89 ; LED8.4 LED8.3 2.61,44.31 2.88,44.59 3.65,44.59 v1(3.83,44.76) ; 14.36,53.92 C9.2 14.36,51.48 C12.2 ; 14.36,53.92 C8.1 ; 14.36,53.92 C13.1 ; R82.2 20.49,7.8 R83.2 19.4,7.91 19.25,7.91 18.81,8.34 U16.16 U16.15 17.29,10.95 17.29,10.44 16.02,9.17 15.51,9.17 ; LED14.2 23.74,8.26 23.74,9.16 ; U13.1 U13.4 ; U13.1 29.08,3.56 U13.5 U13.B12 ; LED11.3 LED11.4 ; C6.2 17.25,57.95 R5.2 17.18,58.09 17.02,58.09 16.89,58.22 16.89,58.71 17.19,59.01 C7.1 arc(17.2,59.89) 17.21,59.91 C2.1 17.54,62.74 v1(22.32,62.74) ; U18.3 14.2,19.75 14.36,19.59 14.54,19.59 v1(14.7,19.43) ; U12.2 29.97,21.84 U12.6 ; v1(8.98,10.92) 9.18,10.92 9.65,10.45 U17.16 U17.15 ; 11.89,16.27 11.9,16.26 v1(11.9,15.62) ; 11.89,16.27 R89.2 ; 11.89,16.27 11.89,17.12 v1(11.69,17.33) ; 11.89,16.27 R88.2 ; v1(14.95,10.79) 14.39,10.79 14.32,10.72 ; SCREW1.1 28.81,58.56 J1.5 J1.4 v1(23.97,49.36) ; C29.1 14.74,21.65 v1(14.74,22.02) 14.74,22.38 16.49,24.13 C42.2 ; U15.A12 6.4,15.28 v1(5.66,15.28) 5.66,14.97 ; C51.1 C45.2 15.07,40.31 14.8,40.58 14.8,41.04 14.7,41.15 ; R3.2 18.5,56.84 D2.2 19.68,56.95 v1(19.7,56.94) ; 15.51,9.17 15.04,9.17 14.41,9.81 14.41,10.63 14.32,10.72 ; 5.01,14.99 5.65,14.99 5.66,14.97 ; 30.45,45.99 v1(30.45,44.42) 30.45,43.84 R60.1 ; 30.45,45.99 R59.1 ; 30.45,45.99 29.05,45.99 Q6.2 ; C3.2 21.79,52.7 v1(21.05,52.7) ; U12.A12 29.38,22.23 29.59,22.23 ; R37.1 4.74,31.39 4.74,33.52 ; 4.74,27.89 6.13,27.89 Q2.2 5.9,28.17 v1(5.14,28.17) ; 4.74,27.89 4.74,26.4 4.74,26.39 R31.1 ; 5.01,10.5 5.01,11.05 5.9,11.94 U14.1 ; LED7.3 v1(1.58,38.47) ; v1(21.45,38) 21.67,38 C48.1 23.59,36.08 23.59,36.01 23.81,35.78 23.81,34.23 ; U12.1 29.97,14.98 U12.5 v1(29.97,15.67) 29.72,15.42 U12.A1 ; 11.88,26.65 11.9,26.67 ; 11.88,26.65 11.75,26.65 11.57,26.46 11.57,25.9 11.75,25.72 11.94,25.72 C43.1 ; R85.2 v1(11.74,7.8) R86.2 11,7.56 v1(10.15,7.56) ; 5.66,14.97 5.66,14.34 5.9,14.1 U15.2 ; v1(1.58,32.88) LED6.3 ; R47.1 4.76,39.09 4.74,39.12 4.74,39.23 ; U18.15 U18.16 ; R117.2 14.05,40.5 13.89,40.65 13.68,40.65 13.55,40.79 13.55,41.47 13.68,41.61 14.41,41.61 14.54,41.47 14.54,41.3 14.7,41.15 ; U23.B12 U23.5 6.48,57.66 6.66,57.84 ; v1(1.58,27.16) LED5.3 ; 4.74,33.52 4.75,33.53 v1(5.07,33.53) Q3.2 ; 4.74,33.52 R42.1 ; 6.66,57.84 U23.A1 ; 6.66,57.84 6.66,58.17 U23.1 U23.4 U23.3 U23.2 6.66,50.55 6.66,51.05 ; 6.66,51.05 U23.A12 ; LED10.3 v1(33.61,40.53) ; U11.15 v1(18.87,18.75) 18.87,17.93 19.06,17.74 19.06,16.97 19.4,16.63 19.91,16.63 20.04,16.76 20.04,16.91 v1(20.14,17.02) R80.2 ; 23.74,9.16 23.24,9.16 ; R48.1 4.74,39.25 6.01,39.25 Q4.2 ; LED9.3 v1(33.61,46.62) ; LED12.4 LED12.3
  Top Layer w0.225: U19.19 14.72,27.57 14.47,27.31 12.95,27.31 v1(11.93,28.33) ; v1(11.25,30.48) C47.1
  Top Layer w0.252: U11.3 22.38,19.75 v1(22.55,19.92) ; v1(25.55,15.03) 25.55,13.76 v1(25.7,13.61) ; v1(24.13,16.95) 23.92,16.95 LED13.2 ; LED16.2 13.31,14.52 v1(12.41,14.52)
  Top Layer w0.254: v1(17.4,26.14) 17.8,26.14 C50.1 ; 29.8,33.66 30.45,34.31 R71.1 ; 29.8,33.66 30.45,33 R72.1 ; 29.8,33.66 29.29,33.66 Q8.2 ; C49.1 16.72,24.61 C42.2 ; C27.1 23.16,13.25 23.01,13.25 ; U18.16 10.87,18.47 v1(10.87,18.16) ; Q5.2 5.64,44.96 4.74,45.86 R54.1 ; 4.59,42.84 4.52,42.91 v1(4.52,43.18) ; v1(15.05,14.34) 15.55,14.34 15.81,14.08 15.81,13.99 15.08,13.26 v1(15.08,12.97)
  Inner1 w0.152: v1(11.74,7.8) 10.38,7.8 v1(10.15,7.56) ; v1(12.41,14.52) 12.41,14.65 12.48,14.72 12.48,15.04 v1(11.9,15.62) 13.53,17.25 v1(13.53,17.53) ; v1(21.89,17.71) 21.21,17.02 v1(20.14,17.02) ; U15.1 4.92,23.59 4.92,27.95 v1(5.14,28.17)
  Inner2 w0.152: v1(21.22,15.67) 21.22,15.94 v1(20.14,17.02) ; v1(12.7,62.88) 8.5,58.68 U23.1 ; v1(10.15,7.56) 9.14,6.55 9.14,5.96 7.95,4.77 ; v1(15.08,12.97) 15.08,11.66 15.2,11.54 15.2,11.27 15.08,11.15 15.08,10.92 v1(14.95,10.79) ; v1(9.11,10.41) 7.54,10.41 7.47,10.34 7.19,10.34 7.12,10.41 6.59,10.41 v1(6.26,10.75) ; v1(1.58,32.88) 4.42,32.88 v1(5.07,33.53) ; v1(23.33,8.51) 23.33,10.29 v1(22.19,11.43) ; v1(15.87,42.04) 15.67,42.24 14.39,42.24 12.42,40.27 11.09,40.27 10.9,40.08 10.9,39.81 11.09,39.62 11.37,39.62 11.45,39.7 15.14,39.7 20.47,45.04 20.78,45.04 27.64,38.18 34.05,38.18 34.28,38.41 34.4,38.41 34.59,38.6 34.59,38.87 34.4,39.06 28.24,39.06 23.79,43.51 23.79,44.84 23.59,45.03 23.32,45.03 22.48,45.88 18.48,45.88 v1(16.55,47.81) ; U15.3 1.9,12.19 2.15,11.94 ; v1(29.97,15.67) 31.51,15.67 U12.4 ; v1(1.58,38.47) 3.92,38.47 v1(4.71,39.25) ; v1(9.87,13.21) 11.09,13.21 v1(12.41,14.52) ; 7.95,4.77 7.95,4.88 9.11,6.04 ; 7.95,4.77 7.95,3.97 v1(8.19,3.74) ; U15.1 U15.4 ; v1(18.02,19.73) 18.87,18.88 v1(18.87,18.75)
  Inner2 w0.225: v1(11.93,28.33) 11.93,29.8 v1(11.25,30.48)
  Inner2 w0.252: v1(22.63,21.19) 22.63,20 v1(22.55,19.92) ; v1(25.55,15.03) 24.02,15.03 23.37,15.68 23.37,16.19 v1(24.13,16.95)
  Bottom Layer w0.152: 24.31,63.23 23.82,62.74 v1(22.32,62.74) 22.06,63 12.06,63 11.94,62.88 ; U3.2 21.23,14.93 20.98,14.67 20.98,14.52 U3.9 U4.9 16.52,14.02 16.22,14.31 U5.2 ; C40.1 33.12,26.53 33.24,26.53 33.63,26.92 33.63,29.71 33.48,29.86 33.12,29.86 32.98,29.99 32.86,29.99 32.59,29.72 32.59,28.48 C37.1 31.73,27.62 C32.1 31.6,27.42 31.6,27.3 31.46,27.17 30.91,27.17 30.64,27.43 30.19,27.43 ; C33.1 3.5,44.44 v1(3.83,44.76) 6.15,47.09 U23.2 ; C36.1 10.52,22.12 9.82,22.82 9.82,24.81 U21.34 ; v1(19.74,24.89) 19.74,23.75 22.19,21.3 ; C30.1 25.19,49.36 v1(23.97,49.36) ; C34.1 4.13,29.18 v1(5.14,28.17) ; 20.28,21.19 20.39,21.3 22.19,21.3 ; U6.9 13.68,14.27 U6.2 ; U10.2 9.85,12.56 9.72,12.44 9.22,12.44 8.71,11.93 8.71,10.54 LED4.1 8.58,9.4 8.58,8.64 9.65,7.56 v1(10.15,7.56) ; 22.63,21.3 C31.1 22.63,21.3 ; 22.63,21.3 22.19,21.3 ; 22.63,21.3 22.19,21.3 ; LED2.1 11.27,17.75 v1(11.69,17.33) ; U14.1 U15.2 ; 19.55,20.26 19.35,20.26 C38.2 19,19.9 C39.1 ; SCREW2.1 2.15,62.39 U23.4 ; U5.9 16.11,14.34 v1(15.05,14.34) ; U21.141 28.42,28.57 30.08,28.57 v1(30.21,28.7) 30.56,29.04 30.69,29.04 R103.1 ; 18.99,14.02 18.99,14.67 18.73,14.93 U4.2 ; v1(14.74,22.02) 14.74,20.21 14.88,20.08 14.88,19.61 v1(14.7,19.43) ; 27.3,4.44 24.51,7.24 24.51,9.58 LED3.1 ; 27.3,4.44 27.3,4.35 SCREW3.1 ; 27.3,4.44 28.06,4.44 U13.1 ; 31.21,24.61 U12.3 ; 11.17,62.23 11.29,62.23 11.94,62.88 ; U12.4 U13.3 ; SCREW4.1 9.31,3.74 v1(8.19,3.74) ; v1(21.45,38) 21.45,39.88 ; 11.94,62.88 v1(12.7,62.88) ; U23.1 15.8,49.03 18.48,49.03 ; 14.16,59.59 14.16,60.05 v1(15.09,60.98) ; 19.78,20.68 19.71,20.61 19.71,20.42
  Bottom Layer w0.252: 23.01,13.25 24.78,15.03 v1(25.55,15.03) ; v1(22.63,21.19) 20.28,21.19 19.78,20.68 19.78,20.43 19.52,20.17 C38.2 ; v1(25.7,13.61) U9.2 ; U6.9 12.92,14.02 v1(12.41,14.52)
  Bottom Layer w0.254: C31.1 23.29,21.21 v1(23.84,21.21) ; U3.9 22.25,13.25 23.01,13.25 ; LED1.1 24.58,16.95 v1(24.13,16.95) ; U6.9 14.72,14.02 v1(15.05,14.34) ; v1(4.52,43.18) 4.01,43.18 3.5,43.69 C33.1 ; LED2.1 v1(10.87,18.16)
  vias: v1(1.03,16.46) v1(1.49,14.99) v1(3.87,33.65) v1(4.54,41.28) v1(4.59,47.58) v1(6.06,45.03) v1(6.39,46.87) v1(6.41,21.29) v1(9.74,25.49) v1(12.92,48.39) v1(15.2,54.08) v1(16.83,54.53) v1(20.6,54.88) v1(21.55,39.88) v1(23.21,13.34) v1(30.44,30.48) v1(30.55,32.12) v1(32.48,29.08) v1(32.65,28.45) v1(33.62,34.8)
VBUS: length 43.5
  Top Layer w0.152: U23.A4 6.59,55.78 6.2,55.78 6.02,55.61 U23.B9 5.17,55.7 3.7,55.7 3.45,55.45 3.45,53.14 3.7,52.88 4.65,52.88 4.78,53.01 5.17,53.01 U23.B4 6.02,53.11 6.2,52.92 6.59,52.92 U23.A9 6.74,52.78 7.13,52.78 7.29,52.62 7.29,52.36 10.18,49.48 10.18,48.13 10.36,47.95 11.7,47.95 15.66,43.99 24.88,43.99 v1(25.07,44.19) ; R122.1 24.84,35.26 24.12,35.98 24.12,36.39 23.88,36.63 v1(23.88,37.64)
  Bottom Layer w0.152: v1(23.88,37.64) 22.95,38.57 22.95,40.74 24.35,42.14 24.35,43.47 v1(25.07,44.19)
VBUS_DET: length 3.3
  Top Layer w0.152: U19.44 23.21,34.33 ; R122.2 24.39,33.79 23.55,33.79 23.38,33.95 23.38,34.18 R123.1
VDD18PLL: length 4.9
  Top Layer w0.152: 14.82,38.66 14.72,38.56 U19.62 ; 14.82,38.66 14.54,38.66 14.54,40.63 14.05,41.13 ; 14.82,38.66 C51.2
VDDA: length 5.1
  Bottom Layer w0.152: C36.2 10.67,21.66 10.48,21.66 10.29,21.84 L8.2 9.3,24.83 U21.35 U21.36
VDDLDO: length 86.1
  Inner2 w0.152: v1(23.46,44.7) 21.96,44.7 21.03,45.63 20.23,45.63 18.82,44.23 17.25,44.23 16.78,44.7 14.95,44.7 14.72,44.94 11.63,44.94 11.49,45.08 10.63,45.08 v1(8.22,42.67)
  Bottom Layer w0.152: 23.82,45.45 24.07,45.21 24.41,45.21 24.66,45.45 24.66,46.41 U21.105 ; 23.82,45.45 23.82,45.07 v1(23.46,44.7) ; 23.82,45.45 23.82,46.41 U21.103 ; 18.24,26.17 18.64,26.58 18.84,26.58 19.18,26.92 22.95,26.92 23.38,27.36 28.21,27.36 U21.143 28.37,27.36 29.32,27.36 29.87,26.81 32.85,26.81 C40.2 32.98,28.16 32.95,28.19 33.01,28.26 33.01,29.42 32.98,29.44 ; 18.24,26.17 17.58,26.83 14.63,26.83 14.28,27.18 9.08,27.18 7.97,26.07 7.97,25.85 7.28,25.17 7.07,25.17 6.92,25.01 3.04,25.01 2.89,25.17 2.89,40.51 5.73,43.36 6.61,43.36 U21.70 6.77,43.36 7.72,43.36 8.22,42.86 v1(8.22,42.67) 8.06,42.52 6.77,42.52 U21.68 ; 18.24,26.17 U21.17 18.24,22.12 ; 18.24,22.12 L7.1 ; 18.24,22.12 18.24,20.86 C39.2
BTN: length 54.1
  Top Layer w0.152: SW1.2 10.32,55.94 v1(11.58,54.67)
  Inner1 w0.152: v1(11.58,54.67) 11.95,54.31 11.95,44.18 8.85,41.08 v1(8.85,40.77)
  Bottom Layer w0.152: 30.31,31.36 28.37,31.36 U21.135 28.21,31.52 26.66,31.52 26,30.86 24.38,30.86 23.66,30.15 23.41,30.15 22.7,30.86 21.48,30.86 20.98,31.37 19.41,31.37 14.98,35.79 14.98,37.36 11.58,40.77 v1(8.85,40.77) 8.68,40.94 U21.65
CAN0_EN: length 54.4
  Top Layer w0.152: v1(23.97,10.92) 25.19,10.92 25.87,11.6 25.87,12.77 26.36,13.27 29.92,13.27 30.41,13.75 30.41,14.06 v1(30.7,14.35)
  Inner2 w0.152: v1(25.49,31.5) 25.62,31.37 30.74,31.37 32.41,33.04 33.75,33.04 34,32.78 34,28.07 31.75,25.82 31.75,22.39 32.24,21.91 33.56,21.91 34,21.46 34,18 32.51,16.51 30.57,16.51 30.3,16.24 29.16,16.24 28.67,15.75 28.67,15.6 29.39,14.87 29.9,14.87 30.02,14.75 30.3,14.75 v1(30.7,14.35)
  Bottom Layer w0.152: U21.134 28.23,31.88 25.87,31.88 v1(25.49,31.5) ; U3.8 20.73,12.44 20.52,12.23 20.52,10.09 20.83,9.78 22.19,9.78 23.33,10.92 v1(23.97,10.92)
CAN0_H: length 74.2
  Top Layer w0.152: J2.2 23,3.25 23,1.07 22.82,0.89 13.05,0.89 12.41,1.52 12.41,4.09 8.02,8.48 8.02,10.05 7.57,10.49 7.51,10.49 v1(7.33,10.67) ; v1(7.33,10.67) 7.15,10.49 7.09,10.49 6.84,10.25 U14.A2 ; v1(7.33,10.67) 7.33,11.32 8.02,12.01 8.02,20.33 v1(7.39,20.95) 7.23,20.79 U15.A2 ; v1(27.52,15.62) 27.88,15.62 28.1,15.84 28.5,15.84 U12.A2 ; U13.A2 28.53,5.21 v1(27.52,5.21)
  Inner1 w0.152: J2.2 20.73,5.52 20.73,9.11 27.24,15.62 v1(27.52,15.62)
  Inner2 w0.152: J2.2 27.02,4.7 v1(27.52,5.21)
  Bottom Layer w0.152: J2.2 21.38,4.88 21.38,8.38 21.03,8.73 ; v1(27.52,15.62) 27.02,16.13 24.47,16.13 23.85,16.75 20.8,16.75 20.65,16.91 20.65,17.12 R15.1
CAN0_L: length 107.3
  Top Layer w0.152: U15.A3 7.24,20.29 v1(7.33,20.19) ; U13.A3 28.5,5.82 28.1,5.82 27.96,5.97 v1(27.52,5.97) ; v1(27.52,16.38) 28.54,16.38 U12.A3 ; v1(7.33,9.91) 7.17,9.75 U14.A3
  Inner1 w0.152: v1(27.52,5.97) 25.36,5.97 ; 25.36,5.97 24.85,5.97 21.77,2.88 21.26,2.88 19.46,1.08 18.57,1.08 17.94,1.71 17.94,2.61 18.57,3.24 20.06,3.24 20.47,3.65 20.47,9.2 27.52,16.25 v1(27.52,16.38) 27.42,16.49 27.05,16.49 26.95,16.38 21.44,16.38 21.21,16.6 v1(18.56,16.6) 17.58,17.58 16.61,17.58 16.47,17.71 14.84,17.71 13.05,15.92 13.05,14.99 13.61,14.43 13.61,14.28 13.69,14.2 14.54,14.2 14.65,14.3 14.65,14.94 14.96,15.25 15.4,15.25 15.72,14.94 15.72,14.2 15.72,14.2 15.72,13.15 14.88,12.31 13.03,12.31 10.81,10.08 7.51,10.08 v1(7.33,9.91) 7.51,9.73 7.57,9.73 7.96,9.34 7.96,4.89 7.62,4.55 7.13,4.55 5.06,6.63 5.06,11.24 4.57,11.72 4.57,14.31 4.72,14.46 4.72,16.21 6.18,17.66 6.18,19.55 6.82,20.19 v1(7.33,20.19) ; 25.36,5.97 J2.1
  Bottom Layer w0.152: v1(18.56,16.6) 19.38,17.42 19.49,17.42 19.99,17.93 R16.1 ; 21.83,8.73 21.83,5.95 22.63,5.15 22.63,4.25 21.83,3.45 21.83,2.43 J2.1
CAN0_RX: length 31.1
  Top Layer w0.152: v1(23.16,14.66) 22.88,14.38 19.75,14.38 18,16.13 18,16.83 16.99,17.83 16.96,17.83 16.65,18.14 16.65,23.51 20.32,27.18 22.56,27.18 23.35,27.97 23.35,29.26 23.71,29.62 24.2,29.62 v1(24.73,29.08)
  Bottom Layer w0.152: U21.136 27.18,30.94 27.15,30.91 27.06,30.91 25.24,29.08 v1(24.73,29.08) ; U3.4 22.39,15.43 v1(23.16,14.66)
CAN0_TX: length 25.6
  Top Layer w0.152: v1(24.79,28.07) 24.17,28.07 22.54,26.44 21.59,26.44 21.01,25.86 21.01,24.04 22.08,22.97 23.35,22.97 24.51,21.81 24.51,17.69 24.11,17.29 23.13,17.29 22.82,16.98 22.82,15.87 22.18,15.23 21.09,15.23 21.04,15.18 20.79,15.18 v1(20.49,15.48)
  Bottom Layer w0.152: v1(24.79,28.07) 27.08,30.36 28.21,30.36 U21.137 ; v1(20.49,15.48) 20.69,15.48 U3.1
CAN1_EN: length 38.1
  Inner1 w0.152: v1(25.04,33.11) 25.02,33.11 23.12,35.01 v1(23.12,37.59)
  Inner2 w0.152: v1(17.72,13.36) 15.59,15.5 15.59,23.42 17.88,25.71 17.88,31.14 23.12,36.39 v1(23.12,37.59)
  Bottom Layer w0.152: v1(17.72,13.36) 17.72,13.11 U4.8 ; U21.130 25.87,33.94 v1(25.04,33.11)
CAN1_H: length 69.7
  Top Layer w0.152: v1(27.52,21.21) 27.88,21.21 28.1,20.99 28.5,20.99 U12.A11 ; U14.A11 7.27,5.25 v1(7.38,5.13) ; v1(7.23,15.19) 7.09,15.33 7.09,15.55 6.85,15.79 U15.A11 ; v1(27.06,11.09) 27.34,11.09 28.1,10.32 28.5,10.32 28.57,10.25
  Inner2 w0.152: J2.4 17.94,5.78 13.49,5.78 11.17,3.46 11.17,2.64 10.41,1.87 9.22,1.87 7.38,3.72 v1(7.38,5.13)
  Bottom Layer w0.152: v1(27.52,21.21) 27.08,20.77 26.5,20.77 26.49,20.78 26.22,20.78 26.21,20.77 22.82,20.77 22.76,20.83 20.54,20.83 20.06,20.36 20.06,20.01 19.52,19.46 18.6,19.46 18.51,19.37 18.19,19.37 17.74,18.92 17.74,18.63 17.78,18.59 17.78,18.11 17.44,17.77 16.96,17.77 16.74,17.98 16.47,17.98 16.01,17.53 R19.1 ; J2.4 18.84,4.88 18.84,8.38 18.49,8.73 18.78,9.02 18.78,9.22 18.95,9.38 23.33,9.38 25.03,11.09 26.51,11.09 26.51,11.09 v1(27.06,11.09) ; v1(7.38,5.13) 7.15,5.36 7.09,5.36 6.75,5.7 6.75,10.91 7.23,11.4 v1(7.23,15.19) 7.78,15.19 8.83,16.23 12.77,16.23 13.17,16.63 14.44,16.63 14.89,17.08 15.36,17.08 15.56,17.29
CAN1_L: length 72.9
  Top Layer w0.152: U14.A10 6.8,5.75 6.83,5.71 7.1,5.71 v1(7.33,5.94) ; v1(27.52,20.45) 28.54,20.45 U12.A10 ; v1(7.33,16.13) 7.17,16.29 U15.A10 ; 28.57,9.75 28.5,9.82 28.1,9.82 28.08,9.79 27.52,9.79
  Inner1 w0.152: J2.3 19.49,2.16 20.57,3.24 21.62,3.24 26.94,8.56 26.94,9.33 27.28,9.67 27.34,9.67 v1(27.52,9.85) 27.7,10.03 27.77,10.03 28.11,10.37 28.11,11.11 27.75,11.46 27.75,14.44 28.11,14.79 28.11,18.64 27.65,19.1 27.28,19.1 26.94,19.44 26.94,19.93 27.46,20.45 ; 27.46,20.45 v1(27.52,20.45) ; 27.46,20.45 26.36,21.55 20.3,21.55 17.19,18.44 v1(17.19,18.36) 14.77,18.36 14.74,18.33 ; 14.7,18.37 14.37,18.37 13.95,18.79 9.03,18.79 8.52,18.28 8.52,17.32 v1(7.33,16.13) 7.15,15.95 7.09,15.95 6.57,15.43 6.57,14.97 7.33,14.21 7.33,11.49 6.75,10.91 6.75,6.17 6.98,5.94 v1(7.33,5.94)
  Bottom Layer w0.152: J2.3 19.29,2.43 19.29,3.45 20.09,4.25 20.09,5.15 19.29,5.95 19.29,8.73 ; v1(17.19,18.36) 17.17,18.38 16.36,18.38 16.06,18.08 R20.1
CAN1_RX: length 37.8
  Inner2 w0.152: v1(32.48,21.21) 31.76,21.21 31.04,21.93 30.56,21.93 28.11,19.49 28.11,15.38 27.77,15.04 27.28,15.04 26.32,16 24,16 v1(23.8,15.81)
  Bottom Layer w0.152: U4.4 19.73,15.76 20.47,16.5 22.83,16.5 23.53,15.81 v1(23.8,15.81) ; v1(32.48,21.21) 33.23,21.21 34.41,22.39 34.41,23.08 34.25,23.23 34.25,27.75 34.31,27.81 34.31,31.31 33.79,31.84 31.63,31.84 30.61,32.86 28.37,32.86 U21.132
CAN1_TX: length 25.6
  Inner2 w0.152: v1(17.75,14.74) 17.6,14.89 17.6,17.2 16.5,18.3 16.5,22.58 16.81,22.9 16.81,22.99 17.16,23.33 17.16,24.07 v1(25.51,32.42)
  Bottom Layer w0.152: v1(17.75,14.74) 17.75,14.95 U4.1 ; U21.133 25.53,32.44 v1(25.51,32.42)
CAN2_EN: length 49.5
  Inner1 w0.152: v1(15.22,13.94) 13.58,13.94 12.79,14.73 12.79,16.02 14.73,17.96 16.83,17.96 16.96,17.83 17.41,17.83 17.54,17.96 21.48,17.96 22.18,18.67 24.22,18.67 24.67,18.22 24.67,17.96 25.72,16.92 v1(26.73,16.92) ; v1(25.5,30.18) 26.26,30.94 26.26,36.91 v1(24.99,38.18)
  Inner2 w0.152: v1(26.73,16.92) 25.85,16.92 24.73,18.03 24.73,24.97 26.25,26.49 26.25,29.42 v1(25.5,30.18)
  Bottom Layer w0.152: U5.8 15.47,12.8 15.47,13.69 v1(15.22,13.94) ; U21.121 25.24,38.44 v1(24.99,38.18)
CAN2_H: length 99.9
  Top Layer w0.152: U12.B2 30.34,20.67 30.8,21.12 v1(30.8,21.35) ; v1(4.17,15.88) 4.48,15.88 4.54,15.94 4.91,15.94 5.01,16.04 ; v1(4.03,5.13) 4.27,5.13 4.54,5.4 4.91,5.4 5.01,5.5 ; U13.B2 30.47,10 30.71,10.24 30.77,10.24 v1(30.95,10.41)
  Bottom Layer w0.152: R23.1 25.48,14.47 25.94,14.92 30.43,14.92 31.4,15.89 31.4,20.5 30.8,21.1 v1(30.8,21.35) 34.55,17.59 34.55,11.18 ; 16.28,0.83 16.28,0.9 15.4,1.78 15.4,3.37 16.47,4.45 16.47,4.7 16.16,5.01 16.16,8.52 15.95,8.73 ; 16.28,0.83 16.33,0.88 33.05,0.88 34.55,2.38 34.55,11.18 ; 16.28,0.83 5.87,0.83 4.03,2.67 v1(4.03,5.13) 3.96,5.13 0.52,8.57 0.52,14.78 1.49,15.75 4.04,15.75 v1(4.17,15.88) ; 34.55,11.18 33.79,10.41 v1(30.95,10.41)
CAN2_L: length 97.8
  Top Layer w0.152: 5.01,6 4.91,5.9 4.54,5.9 4.53,5.89 v1(4.03,5.89) ; U13.B3 30.8,9.5 v1(30.95,9.65) ; U12.B3 30.72,20.17 v1(30.81,20.26) ; v1(4.17,16.64) 4.54,16.64 4.54,16.63 4.91,16.63 5.01,16.54
  Inner1 w0.152: v1(32.39,18.92) 31.05,20.26 v1(30.81,20.26)
  Bottom Layer w0.152: 31.73,12.99 27.87,12.99 26.39,14.47 R24.1 ; 31.73,12.99 31.75,13 31.75,18.28 v1(32.39,18.92) ; 31.73,12.99 31.73,12.83 30.32,11.42 30.32,10.93 30.37,10.89 30.37,10.17 30.71,9.83 30.77,9.83 v1(30.95,9.65) 33.75,9.65 34.2,9.2 34.2,5.02 33.43,4.26 32.24,4.26 31.75,3.77 31.75,1.84 31.05,1.13 17.5,1.13 16.47,2.16 16.75,2.43 16.75,3.45 17.5,4.2 17.5,5.12 16.54,6.09 16.54,7.26 16.45,7.35 16.45,9.22 16.29,9.38 15.61,9.38 15.44,9.22 15.44,8.24 15.4,8.19 15.4,3.87 15.14,3.62 15.14,1.84 14.38,1.08 5.97,1.08 4.56,2.49 4.56,5.36 v1(4.03,5.89) 3.85,6.07 3.55,6.07 0.87,8.74 0.87,10.18 1.29,10.59 2.1,10.59 3.23,11.72 3.23,14.31 3.14,14.4 3.14,14.61 3.83,15.29 4.41,15.29 4.75,15.63 4.75,16.12 4.41,16.46 4.35,16.46 v1(4.17,16.64)
CAN2_RX: length 28.5
  Inner2 w0.152: v1(23.56,31.46) 22.32,30.21 22.32,29.8 15.99,23.47 15.99,18.45 16.94,17.5 v1(16.94,16.89)
  Bottom Layer w0.152: v1(23.56,31.46) 23.84,31.74 23.84,34.11 27.16,37.44 U21.123 ; v1(16.94,16.89) 17.49,16.34 17.49,15.65 U5.4
CAN2_TX: length 70.2
  Inner2 w0.152: v1(33.62,36.96) 34.51,36.07 34.51,13.59 33.87,12.95 31.92,12.95 31.59,12.62 31.59,11.37 33.56,9.4 33.56,7.01 31.92,5.37 31.92,4.46 31.58,4.12 30.41,4.12 27.87,6.66 27.28,6.66 26.1,7.84 25.36,7.84 25.02,8.18 25.02,8.66 25.87,9.52 25.87,11.05 25.06,11.86 25.06,11.94 24.72,12.29 23.44,12.29 23.22,12.06 22.5,12.06 19.83,14.74 19.83,16.09 v1(18.49,17.43)
  Bottom Layer w0.152: U21.122 32.22,37.94 32.32,37.84 32.81,37.84 32.91,37.94 32.91,37.73 33.32,37.32 33.32,37.25 v1(33.62,36.96) ; v1(18.49,17.43) 18.43,17.37 17.21,17.37 17.16,17.42 16.72,17.42 16.67,17.37 16.32,17.37 15.81,16.86 15.81,15.47 U5.1
CAN3_EN: length 44.4
  Top Layer w0.152: v1(25.83,19.7) 25.14,19.01 25.14,12.36 v1(24.48,11.7)
  Inner2 w0.152: v1(25.83,19.7) 25.82,19.71 25.82,21.15 31.61,26.93 31.61,29.61 31.71,29.72 31.78,29.72 32.71,30.64 32.71,32.4 v1(32.65,32.45) ; v1(13.83,9.67) 14.59,9.67 16.73,11.81 24.37,11.81 v1(24.48,11.7)
  Bottom Layer w0.152: v1(13.83,9.67) 13.32,9.67 12.81,10.18 12.81,12.22 U6.8 ; U21.131 30.41,33.44 31.39,32.45 v1(32.65,32.45)
CAN3_H: length 95.3
  Top Layer w0.152: v1(3.92,21.12) 4.06,21.12 4.64,20.54 5.01,20.54 ; U13.B11 30.53,5.5 30.75,5.28 30.75,5.22 31.09,4.88 31.16,4.88 v1(31.33,4.7) 33.48,4.7 34.41,3.77 34.41,3.08 33.92,2.6 28.24,2.6 25.06,5.78 21.11,5.78 20.47,5.15 20.47,4.7 20.09,4.32 20.09,4.25 19.46,3.62 15.01,3.62 J2.8 ; 5.01,10 4.91,10.09 4.54,10.09 4.03,10.61 v1(4.03,10.67) ; U12.B11 30.78,16.17 v1(30.81,16.13)
  Inner1 w0.152: v1(2.81,16.51) 3.33,15.99 3.33,12.1 4.03,11.4 v1(4.03,10.67) ; v1(32.35,16.13) 33.55,14.92 33.92,14.92 34.41,14.44 34.41,7.71 31.58,4.88 31.51,4.88 v1(31.33,4.7) ; 2.21,8.86 2.35,8.72 2.35,5.15 3.59,3.92 3.59,2.09 4.78,0.9 12.17,0.9 12.35,1.08 12.35,3.11 J2.8
  Inner2 w0.152: 2.21,8.86 2.21,9 3.87,10.67 v1(4.03,10.67) ; v1(32.35,16.13) v1(30.81,16.13)
  Bottom Layer w0.152: 10.5,14.99 10.57,14.99 11.52,14.04 11.52,10.61 13.75,8.38 13.75,4.88 J2.8 ; v1(3.92,21.12) 3.7,20.9 3.66,20.9 3.19,20.43 3.05,20.43 2.71,20.09 2.71,19.61 2.81,19.5 v1(2.81,16.51)
  vias: v1(2.25,8.81)
